# Altium schematic sheet CAN.SchDoc
size A4; SheetNumber: 6; SheetTotal: 10
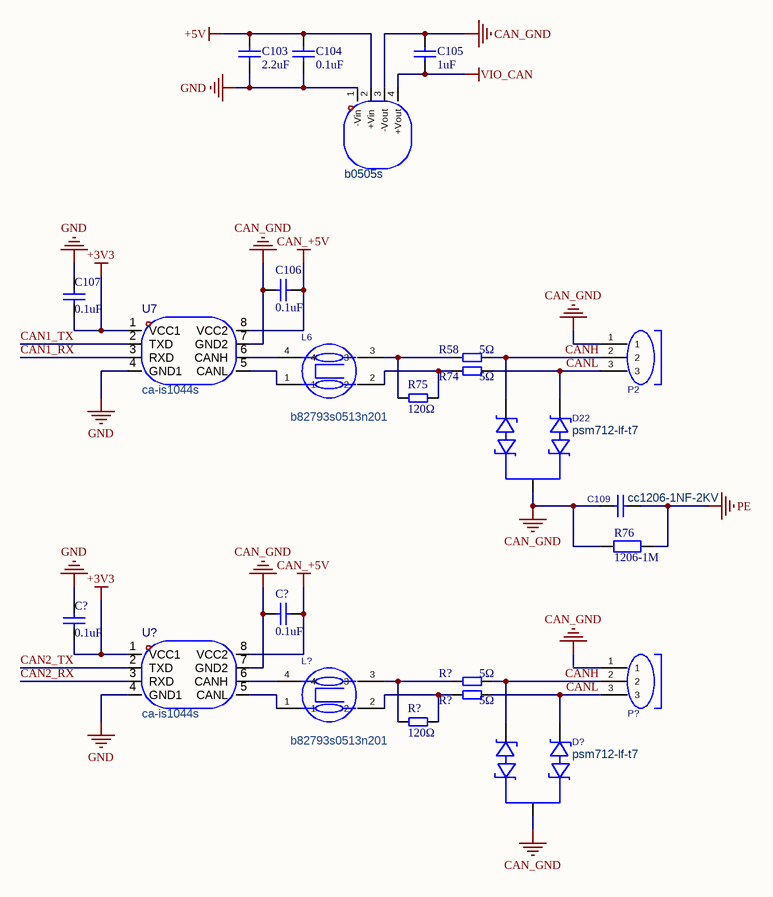
[diagram p0: CAN.SchDoc]

## Parts
(Parts that share a designator on the sheet are numbered #1, #2 ... from top to bottom, then left to right.)
?  b0505s  [PWRM-TH_B0505S-1WR3]
C103  2.2uF  [C0603]
C104  0.1uF  [C0603]
C105  1uF  [C0603]
C106  0.1uF  [C0603]
C107  0.1uF  [C0603]
C109  cc1206-1NF-2KV  [C1206]
C?#1  0.1uF  [C0603]
C?#2  0.1uF  [C0603]
D22  psm712-lf-t7  [SOT-23-3_L3.0-W1.7-P0.95-LS2.9-BR]
D?  psm712-lf-t7  [SOT-23-3_L3.0-W1.7-P0.95-LS2.9-BR]
L6  b82793s0513n201  [FILTER-SMD_4P-L9.0-W6.0_B82790]
L?  b82793s0513n201  [FILTER-SMD_4P-L9.0-W6.0_B82790]
P2  wj500v-5.08-03p-14-00a  [CONN-TH_3P-P3.81_WJ15EDGRC-3.81-3P]  (value not drawn)
P?  wj500v-5.08-03p-14-00a  [CONN-TH_3P-P3.81_WJ15EDGRC-3.81-3P]  (value not drawn)
R58  5Ω  [R0603]
R74  5Ω  [R0603]
R75  120Ω  [R0603]
R76  1206-1M  [F1206]
R?#1  5Ω  [R0603]
R?#2  5Ω  [R0603]
R?#3  120Ω  [R0603]
U7  ca-is1044s  [SOIC-8_L4.9-W3.9-P1.27-LS6.0-BL]
U?  ca-is1044s  [SOIC-8_L4.9-W3.9-P1.27-LS6.0-BL]

## Nets
+3V3: C107.1 C?#2.1 U7.1(VCC1) U?.1(VCC1)
+5V: ?.2(+Vin) C103.2 C104.2
CAN_+5V: C106.2 C?#1.2 U7.8(VCC2) U?.8(VCC2)
CAN_GND: ?.3(-Vout) C105.2 C106.1 C109.1 C?#1.1 D22.3(K) D?.3(K) P2.1 P?.1 R76.1 U7.7(GND2) U?.7(GND2)
GND: ?.1(-Vin) C103.1 C104.1 C107.2 C?#2.2 U7.4(GND1) U?.4(GND1)
PE: C109.2 R76.2
VIO_CAN: ?.4(+Vout) C105.1
CAN1_RX: U7.3(RXD)
CAN1_TX: U7.2(TXD)
CAN2_RX: U?.3(RXD)
CAN2_TX: U?.2(TXD)
CANH: D22.2(A1) D?.2(A1) P2.2 P?.2 R58.2 R?#1.2
CANL: D22.1(A1) D?.1(A1) P2.3 P?.3 R74.2 R?#2.2
NetL6_1: L6.1 U7.5(CANL)
NetL6_2: L6.2 R74.1 R75.2
NetL6_3: L6.3 R58.1 R75.1
NetL6_4: L6.4 U7.6(CANH)
NetL?_1: L?.1 U?.5(CANL)
NetL?_2: L?.2 R?#2.1 R?#3.2
NetL?_3: L?.3 R?#1.1 R?#3.1
NetL?_4: L?.4 U?.6(CANH)

## Library data of the parts
? = b0505s-1wr3_c7465178: B0505S-1WR3型号是定电压输入,隔离非稳压单路输出的DC/DC模块电源产品；输入电压5V(4.5V~5.5V)，输出电压5Vdc，输出电流200mA，输出功率1W;转换效率86%;低静态电流，低纹波系数和低噪音，超低功耗;输出可持续短路保护，自恢复;最大容性负载2400uF;适用于纯数字电路，一般低频模拟电路，继电器驱动电路，数据交换电路等 ;输入输出隔离耐压1.5KVdc ;尺寸：长11.68*高10.16*宽6.00mm; Manufacturer: EVISUN(易成); AddInBom: yes; ModelId: 30eab2842705423fac4a2e76b933247c; ModelTransform: 456.692,236.22,0,0,0,0,0,82.677,-157.48; Number of Outputs: 1; Output Power: 1W; Conversion Efficiency: 86%; Output Voltage: 5V; Output Current(Max): 200mA; Capacitive Load(Max): 2400uF; Isolation Voltage(Vrms): 1.5kV; Value: 200kHz~340kHz; Quiescent Supply Current: 6mA; Ripple Noise: 30mVp-p; Voltage Regulation: 非稳压型; Symbol: B0505S-1WR3_C7465178; LCSC Part Name: 4.5V~5.5V 5V 200mA 1W; SupplierPart: C7465178; ManufacturerPart: B0505S-1WR3; Supplier Footprint: SIP,11.7x6mm; JLCPCB Part Class: Extended Part; Datasheet: https://item.szlcsc.com/datasheet/B0505S-1WR3/8505845.html; Supplier: LCSC; ConvertToPcb: yes; FootprintName: PWRM-TH_B0505S-1WR3; ModelName: PWRM-TH_B0505S-1WR3; Type: 塑封型; Voltage - Supply: 4.5V~5.5V; Features: 短路保护；自动故障恢复; Operating Temperature: -40℃~+105℃; Length: 11.68mm; Width: 10.2mm; Height: 6mm
C103-C107 C?#1 C?#2 = C0603: Capacitor; Value: 104; Published: 8-Jun-2000; LatestRevisionDate: 17-Jul-2002; LatestRevisionNote: Re-released for DXP Platform.; Publisher: Altium Limited
C109 = cc1206kkx7rdbb102: 容值:1nF;精度:±10%;额定电压:2kV;温度系数:X7R;; Manufacturer: YAGEO(国巨); AddInBom: yes; ModelId: e4be705b945545a48e666415e3682bd8; ModelName: C1206_L3.2-W1.6-H1.3; ModelTransform: 125.984,62.992,0,0,0,0,0,0,0; Value: 1nF; Tolerance: ±10%; Voltage Rating: 2kV; Temperature Coefficient: X7R; Symbol: CC1206KKX7RDBB102; LCSC Part Name: 1nF ±10% 2kV; SupplierPart: C23631; ManufacturerPart: CC1206KKX7RDBB102; Supplier Footprint: 1206; JLCPCB Part Class: Extended Part; Datasheet: https://item.szlcsc.com/datasheet/CC1206KKX7RDBB102/24367.html; Supplier: LCSC; ConvertToPcb: yes; FootprintName: C1206
D22 D? = psm712-lf-t7: 极性:单向;反向截止电压(Vrwm):12V;钳位电压:19V;峰值脉冲电流(Ipp):34A@8/20us；30A@8/20us;峰值脉冲功率(Ppp):600W@8/20us;击穿电压(VBR):13.3V;; Manufacturer: PROTEK; AddInBom: yes; ModelId: 89cb27a44ab2466697082bb9fd73a7d0; ModelName: SOT-23-3L_L2.9-W1.6-H1.1-LS2.8-P0.95; ModelTransform: 114.173,110.236,0,90,0,0,0,0,0; Polarity: 单向; Reverse Stand-Off Voltage (Vrwm): 12V; Clamping Voltage: 19V; Voltage - Breakdown: 13.3V; Reverse Leakage Current (Ir): 1uA；20uA; level of protection: IEC 61000-4-4；IEC 61000-4-5；IEC 61000-4-2; Type: TVS; Junction Capacitance: 75pF; Symbol: PSM712-LF-T7; LCSC Part Name: 单向TVS 12V截止 峰值浪涌电流：34A@8/20us 30A@8/20us; SupplierPart: C32677; ManufacturerPart: PSM712-LF-T7; Supplier Footprint: SOT-23; JLCPCB Part Class: Basic Part; Datasheet: https://item.szlcsc.com/datasheet/PSM712-LF-T7/33642.html; Supplier: LCSC; ConvertToPcb: yes; FootprintName: SOT-23-3_L3.0-W1.7-P0.95-LS2.9-BR; Peak Pulse Current (Ipp): 34A@8/20us；30A@8/20us; Peak Pulse Power Dissipation (Ppp): 600W@8/20us; Operating Temperature: -55℃~+150℃
L6 L? = b82793s0513n201: 通道数:2;电感@频率:51uH@100kHz;直流电阻(DCR):140mΩ;; Manufacturer: TDK; Symbol: B82793S513N201; AddInBom: yes; ModelId: 4e9188432b8b448ba84ed56da6aff49a; ModelName: FILTER-SMD_4P-L7.1-W6.0-H4.8-LS9.0; ModelTransform: 355.35937,236.22,0,90,0,0,-0.034,0,0; Number of Lines: 2; Current Rating: 800mA; Voltage Rating - DC: 80V; Voltage Rating (AC): 42V; Voltage Withstand: 250V; DC Resistance(DCR): 140mΩ; LCSC Part Name: 两路 贴片共模滤波器; SupplierPart: C97047; ManufacturerPart: B82793S0513N201; Supplier Footprint: SMD; JLCPCB Part Class: Extended Part; Datasheet: https://item.szlcsc.com/datasheet/B82793S0513N201/98252.html; Supplier: LCSC; ConvertToPcb: yes; FootprintName: FILTER-SMD_4P-L9.0-W6.0_B82790; Inductance @ Frequency: 51uH@100kHz; Operating Temperature: -40℃~+125℃
P2 P? = WJ15EDGRC-3.81-03P-14-00A: 结构:1x3P;间距:5.08mm;颜色:绿色;安装类型:直插;排数:1;每排PIN数:3;额定电流:18A;额定电压:250V;线规 - AWG:14~30;线规 - 平方毫米:2.5;工作温度:-40℃~+105℃;; Manufacturer: KANGNEX(康奈克斯电气); Symbol: WJ500V-5.08-3P-14-00A; AddInBom: yes; ModelId: f80d5090781743d49abcb05979f5618f; ModelName: CONN-TH_3P-P5.00_WJ500V-5.08-3P; ModelTransform: 623.621,393.7,0,0,0,0,11.811,-20.315,-177.165; Number of Positions or Pins: 1x3P; Pitch: 5.08mm; Number of PINs Per Row: 3; Screw Specification: M2.5; Current Rating: 18A; Voltage Rating (Max): 250V; Wire Gauge - AWG: 14~30; Wire Gauge - mm2: 2.5; LCSC Part Name: 1x3P 5.08mm 直插 排数:1 每排P数:3; SupplierPart: C72334; ManufacturerPart: WJ500V-5.08-03P-14-00A; Supplier Footprint: 插件,P=5.08mm; JLCPCB Part Class: Extended Part; Datasheet: https://item.szlcsc.com/datasheet/WJ500V-5.08-03P-14-00A/73443.html; Supplier: LCSC; ConvertToPcb: yes; FootprintName: CONN-TH_3P-P5.00_WJ500V-5.08-3P; Color: 绿色; Mounting Type: 直插; Number of Pins: 3P; Number of Rows: 1; Operating Temperature: -40℃~+105℃; Height Above Board: 14.07mm
R58 R74 R75 R?#1-R?#3 = 0603-1KΩ-5%: 片式电阻; 物料描述: 片式电阻器-0805-10KΩ-5%-JT; 物料号: NA
R76 = R1206: 特性：I Hold：0.05 ~ 3.0A。 快速响应故障电流。 尺寸1206 / 3.2×1.6mm。 低电阻。 低轮廓。 符合RoHS标准，无铅且无卤。应用：USB集线器、端口和外围设备。 计算机、手机、多媒体设备; Published: 8-Jun-2000; LatestRevisionDate: 17-Jul-2002; LatestRevisionNote: Re-released for DXP Platform.; Publisher: Altium Limited
U7 U? = ca-is1044s: 隔离CAN; Manufacturer: Chipanalog(川土微); AddInBom: yes; ModelId: e81d2f7d937b4a6ab1dca543ff5d56a4; ModelName: SOIC-8_L4.9-W3.9-H1.7-LS6.0-P1.27; ModelTransform: 192.913,236.22,0,0,0,0,0,0,0; Data Rate(Max): 2Mbps; Isolation Voltage(Vrms): 3750; CMTI(kV/us): 100kV/us; Symbol: CA-IS1044S; LCSC Part Name: CA-IS1044S 3.75kVRMS 隔离 CAN 收发器; SupplierPart: C7424699; ManufacturerPart: CA-IS1044S; Supplier Footprint: SOIC-8-NB; JLCPCB Part Class: Extended Part; Datasheet: https://item.szlcsc.com/datasheet/CA-IS1044S/8412095.html; Supplier: LCSC; ConvertToPcb: yes; FootprintName: SOIC-8_L4.9-W3.9-P1.27-LS6.0-BL; Features: 失效安全；总线故障检测与保护; Operating Temperature: -40℃~+125℃